# Altium schematic sheet power_supply.SchDoc
size A4
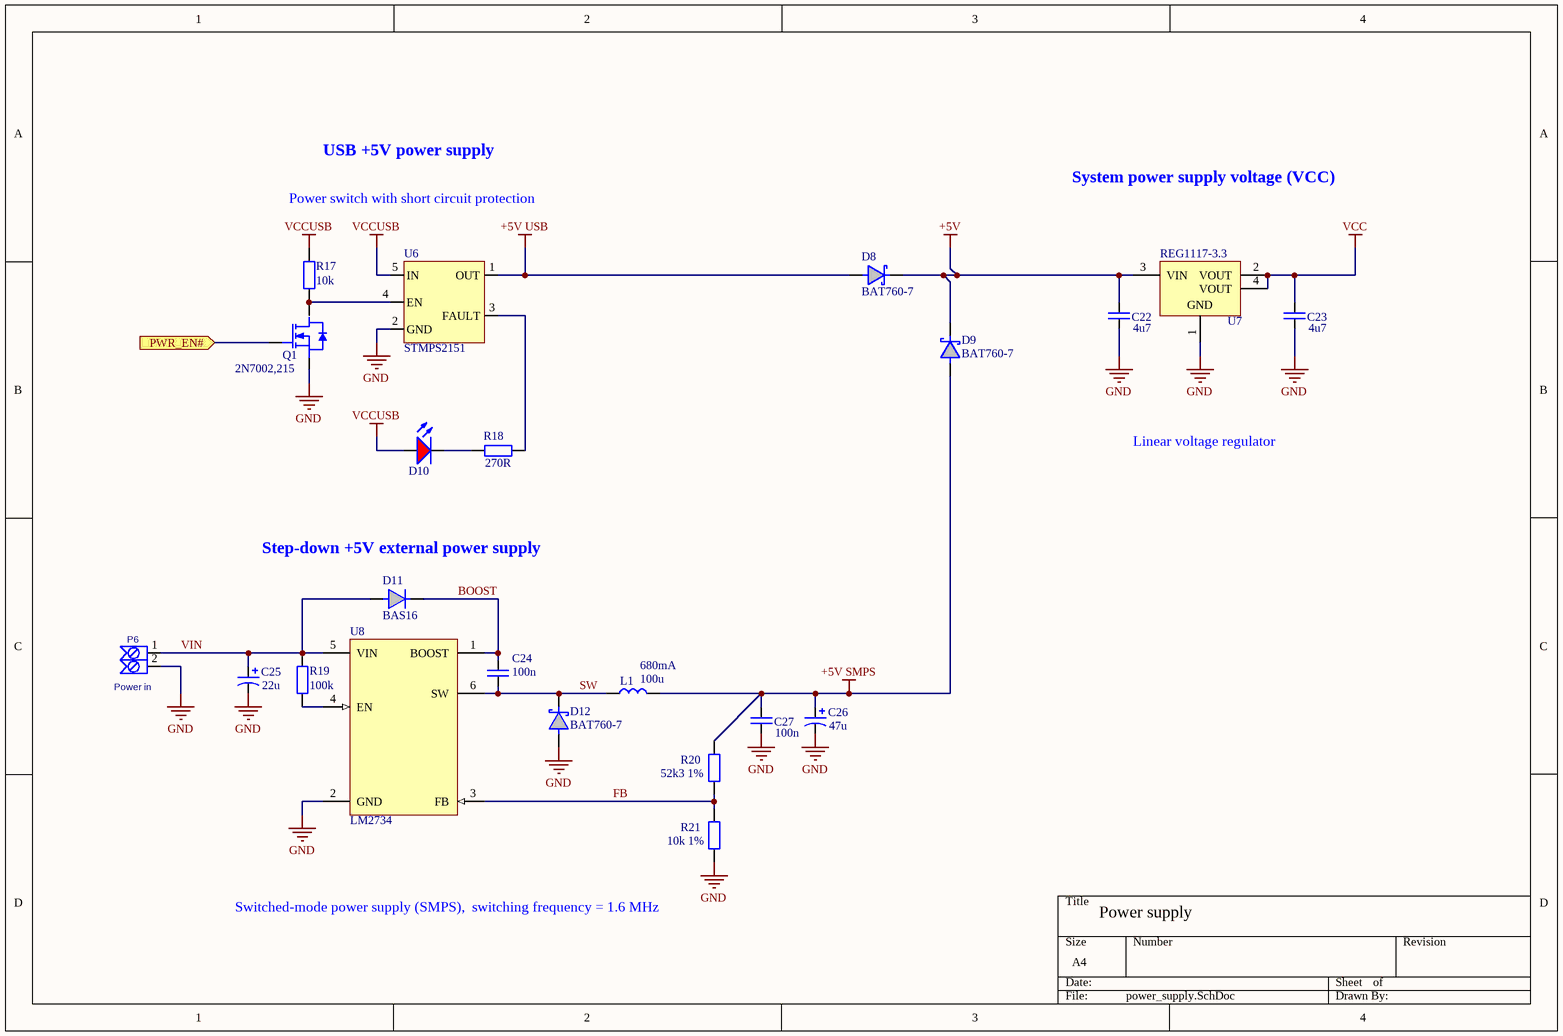
[diagram p0: power_supply.SchDoc]

## Parts
C22  value 4u7  [C_0805]  (hidden comment: comment)
C23  value 4u7  [C_0805]  (hidden comment: comment)
C24  value 100n  [C_0805]  (hidden comment: comment)
C25  value 22u  [Tantalum Case A]  (hidden comment: comment)
C26  value 47u  [Tantalum Case A]  (hidden comment: comment)
C27  value 100n  [C_0805]  (hidden comment: comment)
D8  BAT760-7  [SOD-323]
D9  BAT760-7  [SOD-323]
D10  LED Red  [LED_0805]  (value not drawn)
D11  BAS16  [SOT23-3]
D12  BAT760-7  [SOD-323]
L1  680mA  value 100u  [IND_6060_N]
P6  Power in  [VRSTNA SPONKA 2P/16A]
Q1  2N7002,215  [SOT23-3]
R17  value 10k  [R_0805]  (hidden comment: comment)
R18  value 270R  [R_0805]  (hidden comment: comment)
R19  value 100k  [R_0805]  (hidden comment: comment)
R20  value 52k3 1%  [R_0805]  (hidden comment: comment)
R21  value 10k 1%  [R_0805]  (hidden comment: comment)
U6  STMPS2151  [SOT23-5]
U7  REG1117-3.3  [SOT-223-4]
U8  LM2734  [SOT-23-6-THIN]

## Ports
PWR_EN# (in)

## Nets
+5V: C22.1 D8.C D9.C U7.3(VIN)
+5V SMPS: C26.1 C27.1 D9.A L1.2 R20.2
+5V USB: D8.A U6.1(OUT)
GND: C22.2 C23.2 C25.2 C26.2 C27.2 D12.A P6.2 Q1.2(S) R21.1 U6.2(GND) U7.1(GND) U8.2(GND)
VCC: C23.1 U7.2(VOUT) U7.4(VOUT)
VCCUSB: D10.2(+) R17.2 U6.5(IN)
BOOST: C24.1 D11.C U8.1(BOOST)
FB: R20.1 R21.2 U8.3(FB)
PWR_EN#: Q1.1(G) ; port PWR_EN#
SW: C24.2 D12.C L1.1 U8.6(SW)
VIN: C25.1 D11.A P6.1 R19.1 U8.5(VIN)
NetD10_1: D10.1(-) R18.1
NetQ1_3: Q1.3(D) R17.1 U6.4(EN)
NetR18_2: R18.2 U6.3(FAULT)
NetR19_2: R19.2 U8.4(EN)

## Notes on the sheet
- USB +5V power supply
- Power switch with short circuit protection
- System power supply voltage (VCC)
- Linear voltage regulator
- (near D11) Step-down +5V external power supply
- (near R21) Switched-mode power supply (SMPS),  switching frequency = 1.6 MHz
- Power supply

## Library data of the parts
C22-C24 C27 = Capacitor: Generic capacitor
C25 C26 = Capacitor - polarized: Generic polarized capacitor
D8 D9 D12 = BAT760-7: Schottky Rectifier, 30 V, 1 A, Single, SOD-323, 2 Pins, 550 mV
D11 = BAS16: Silicon Switching Diode for High-Speed Switching; pin to pad: A>1 C>3
L1 = SDR0604-101KL: Power Inductor (SMD), 100 µH, 520 mA, Unshielded, 680 mA, SDR0604
P6 = Screw terminal 2P 200mil: Generic screw terminal, 2 poles, 200 mil pitch; Value: *
Q1 = 2N7002,215: N-Channel Trench MOSFET, 60 V, 0.3 A, 3-Pin SOT23, Tape and Reel; Manufacturer: NXP Semiconductors; Channel Type: N; Ciss [typ] (pF): 31; Coss [typ] (pF): 6.8; ID [max] (A): 0.3; Packing: Tape & Reel; Qr [typ] (nC): 30; VDS [max] (V): 60; VGSth [typ] (V): 2; DatasheetVersion: Rev. 7; PackageVersion: 06-03-16, 03/2006; PackageReference: SOT23; PackageDescription: 3-Pin Small Outline Transistor Package, Body 2.9 x 1.3 mm, Pitch 0.95 mm; Supplier 1: Digi-Key; Supplier Part Number 1: 568-1369-2-ND; Supplier 2: Digi-Key; Supplier Part Number 2: 568-1369-1-ND; Supplier 3: Digi-Key; Supplier Part Number 3: 568-1369-6-ND; Supplier 4: Farnell; Supplier Part Number 4: 2315576; Supplier 5: Farnell; Supplier Part Number 5: 1510761; Supplier 6: Farnell; Supplier Part Number 6: 1510761RL; Supplier 7: Newark; Supplier Part Number 7: 75R4879; Supplier 8: Newark; Supplier Part Number 8: 70R9742; Supplier 9: Mouser; Supplier Part Number 9: 771-2N7002-T/R; Mounting Technology: Surface Mount; Code_JEDEC: TO-236AB; PartNumber: 2N7002,215; ComponentLink1Description: Manufacturer URL; ComponentLink1URL: http://www.nxp.com/; ComponentLink2Description: Datasheet; ComponentLink2URL: http://www.nxp.com/documents/data_sheet/2N7002.pdf; ComponentLink3Description: Package Specification; ComponentLink3URL: http://www.nxp.com/documents/outline_drawing/sot023_po.pdf; HelpURL: https://www.farnell.com/datasheets/1499179.pdf
R17-R21 = Resistor: Generic resistor
U6 = STMPS2151: Power Load Switch, Single High Side, Active High, 1 Output, 5V, 0.5A, SOT-23-5; Supplier 1: Farnell; Supplier Part Number 1: 1842616; HelpURL: https://www.farnell.com/datasheets/1700527.pdf; Manufacturer part number: STMPS2151
U7 = REG1117-3.3: Single Output LDO, 800 mA, Fixed 3.3 V Output, 3.8 to 15 V Input, with Internal Current Limiting, 4-pin SOT-223 (DCY), -40 to 125 degC, Green (RoHS & no Sb/Br); Manufacturer: Texas Instruments; Fixed Output Options(V): 5; Iout(Max)(A): 0.8; Iq(Typ)(mA): 4; Rating: Catalog; SubFamily: Single Channel LDO; Vdo(Typ)(mV): 1100; Vin(Max)(V): 15; Vin(Min)(V): 3.8; Vout Adj(Max)(V): 3.3; DatasheetVersion: SBVS001D; PackageVersion: 4202506/B; PackageReference: DCY4; PackageDescription: 4-Pin Plastic Small Outline, Body 3.5 x 6.5 mm, Pitch 2.3 mm; Supplier 1: Digi-Key; Supplier Part Number 1: REG1117-3.3-ND; Supplier 2: Farnell; Supplier Part Number 2: 1212355; Supplier 3: Farnell; Supplier Part Number 3: 2126471; Supplier 4: Newark; Supplier Part Number 4: 35C1963; Supplier 5: Mouser; Supplier Part Number 5: 595-REG1117-3.3; Eco-Plan: Green (RoHS & no Sb/Br); Vout Adj(Min)(V): 3.3; Mounting Technology: Surface Mount; Code_JEDEC: TO-261; PartNumber: REG1117-3.3; ComponentLink1Description: Manufacturer URL; ComponentLink1URL: http://www.ti.com/; ComponentLink2Description: Datasheet; ComponentLink2URL: http://www.ti.com/general/docs/lit/getliterature.tsp?genericPartNumber=REG1117-33&fileType=pdf; ComponentLink3Description: Package Specification; ComponentLink3URL: http://www.ti.com/litv/pdf/mpds094a; HelpURL: http://www.ti.com/general/docs/suppproductinfo.tsp?distId=26&gotoUrl=http%3A%2F%2Fwww.ti.com%2Flit%2Fgpn%2FREG1117
U8 = LM2734: Thin SOT23 1A Load Step-Down DC-DC Regulator; PartNumber: LM2734XMK; Manufacturer: National Semiconductor; CompType: Switcher; PackageTopMarking: SFDB*XTT; PowerWise: N; FirstPublished: 4-Dec-2008; DatasheetVersion: Jun-2008; PackageVersion: revD, Jul-2005; PackageReference: MK06A; Publisher: Altium Limited; PackageDescription: Molded TSOT, 2.97 x 1.65 x 0.87mm Body, 6 Lead, 0.95mm Pitch; RoHS: Y; PinCount: 6; DigiKeyPartNumber: LM2734XMKCT-ND; Code_JEDEC: MO-193-AA; Code_IPC: SOT26A-6; ComponentLink1Description: LM2734 Datasheet; ComponentLink1URL: http://www.national.com/ds/LM/LM2734.pdf; ComponentLink2Description: LM2734 Web Page; ComponentLink2URL: http://www.national.com/pf/LM/LM2734.html; ComponentLink3Description: MK06A Package Page; ComponentLink3URL: http://www.national.com/packaging/folders/mk06a.html; Supplier 1: Farnell; Supplier 2: Farnell; HelpURL: https://www.ti.com/lit/ds/symlink/lm2734.pdf